# EAGLE design evb_to_w_adapter (EAGLE 6.2)
Assembly variants: ACSI, SCSI
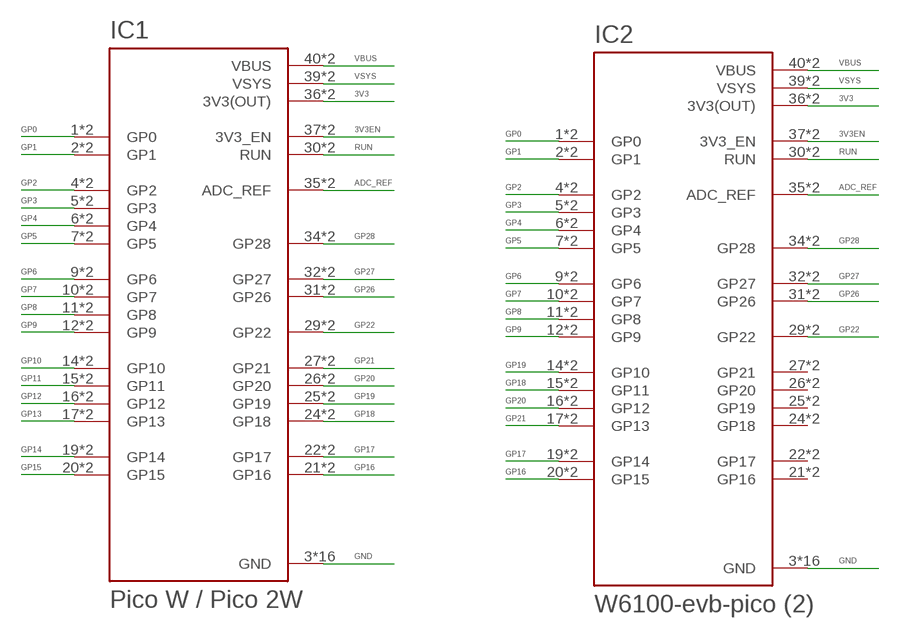
[diagram p0: schematic, sheet 1]

## Parts
IC1  Pico W / Pico 2W  RASPBERRY_PICOSMD-TH  [PICO-PKG]
IC2  W6100-evb-pico (2)  RASPBERRY_PICOSMD-TH  [PICO-PKG]

## Nets
3V3: IC1.36(3V3(OUT)) IC1.P$36(3V3(OUT)) IC2.36(3V3(OUT)) IC2.P$36(3V3(OUT))
3V3EN: IC1.37(3V3_EN) IC1.P$37(3V3_EN) IC2.37(3V3_EN) IC2.P$37(3V3_EN)
ADC_REF: IC1.35(ADC_REF) IC1.P$35(ADC_REF) IC2.35(ADC_REF) IC2.P$35(ADC_REF)
GND: IC1.3(GND) IC1.8(GND) IC1.13(GND) IC1.18(GND) IC1.23(GND) IC1.28(GND) IC1.33(GND) IC1.38(GND) IC1.P$3(GND) IC1.P$8(GND) IC1.P$13(GND) IC1.P$18(GND) IC1.P$23(GND) IC1.P$28(GND) IC1.P$33(GND) IC1.P$38(GND) IC2.3(GND) IC2.8(GND) IC2.13(GND) IC2.18(GND) IC2.23(GND) IC2.28(GND) IC2.33(GND) IC2.38(GND) IC2.P$3(GND) IC2.P$8(GND) IC2.P$13(GND) IC2.P$18(GND) IC2.P$23(GND) IC2.P$28(GND) IC2.P$33(GND) IC2.P$38(GND)
GP0: IC1.1(GP0) IC1.P$1(GP0) IC2.1(GP0) IC2.P$1(GP0)
GP1: IC1.2(GP1) IC1.P$2(GP1) IC2.2(GP1) IC2.P$2(GP1)
GP2: IC1.4(GP2) IC1.P$4(GP2) IC2.4(GP2) IC2.P$4(GP2)
GP3: IC1.5(GP3) IC1.P$5(GP3) IC2.5(GP3) IC2.P$5(GP3)
GP4: IC1.6(GP4) IC1.P$6(GP4) IC2.6(GP4) IC2.P$6(GP4)
GP5: IC1.7(GP5) IC1.P$7(GP5) IC2.7(GP5) IC2.P$7(GP5)
GP6: IC1.9(GP6) IC1.P$9(GP6) IC2.9(GP6) IC2.P$9(GP6)
GP7: IC1.10(GP7) IC1.P$10(GP7) IC2.10(GP7) IC2.P$10(GP7)
GP8: IC1.11(GP8) IC1.P$11(GP8) IC2.11(GP8) IC2.P$11(GP8)
GP9: IC1.12(GP9) IC1.P$12(GP9) IC2.12(GP9) IC2.P$12(GP9)
GP10: IC1.14(GP10) IC1.P$14(GP10)
GP11: IC1.15(GP11) IC1.P$15(GP11)
GP12: IC1.16(GP12) IC1.P$16(GP12)
GP13: IC1.17(GP13) IC1.P$17(GP13)
GP14: IC1.19(GP14) IC1.P$19(GP14)
GP15: IC1.20(GP15) IC1.P$20(GP15)
GP16: IC1.21(GP16) IC1.P$21(GP16) IC2.20(GP15) IC2.P$20(GP15)
GP17: IC1.22(GP17) IC1.P$22(GP17) IC2.19(GP14) IC2.P$19(GP14)
GP18: IC1.24(GP18) IC1.P$24(GP18) IC2.15(GP11) IC2.P$15(GP11)
GP19: IC1.25(GP19) IC1.P$25(GP19) IC2.14(GP10) IC2.P$14(GP10)
GP20: IC1.26(GP20) IC1.P$26(GP20) IC2.16(GP12) IC2.P$16(GP12)
GP21: IC1.27(GP21) IC1.P$27(GP21) IC2.17(GP13) IC2.P$17(GP13)
GP22: IC1.29(GP22) IC1.P$29(GP22) IC2.29(GP22) IC2.P$29(GP22)
GP26: IC1.31(GP26) IC1.P$31(GP26) IC2.31(GP26) IC2.P$31(GP26)
GP27: IC1.32(GP27) IC1.P$32(GP27) IC2.32(GP27) IC2.P$32(GP27)
GP28: IC1.34(GP28) IC1.P$34(GP28) IC2.34(GP28) IC2.P$34(GP28)
RUN: IC1.30(RUN) IC1.P$30(RUN) IC2.30(RUN) IC2.P$30(RUN)
VBUS: IC1.40(VBUS) IC1.P$40(VBUS) IC2.40(VBUS) IC2.P$40(VBUS)
VSYS: IC1.39(VSYS) IC1.P$39(VSYS) IC2.39(VSYS) IC2.P$39(VSYS)
Unconnected: IC2.21(GP16) IC2.22(GP17) IC2.24(GP18) IC2.25(GP19) IC2.26(GP20) IC2.27(GP21) IC2.P$21(GP16) IC2.P$22(GP17) IC2.P$24(GP18) IC2.P$25(GP19) IC2.P$26(GP20) IC2.P$27(GP21)

## Library data of the parts
IC1 IC2 = RpiPico:RASPBERRY_PICO: Raspberry Pi Pico

## Board
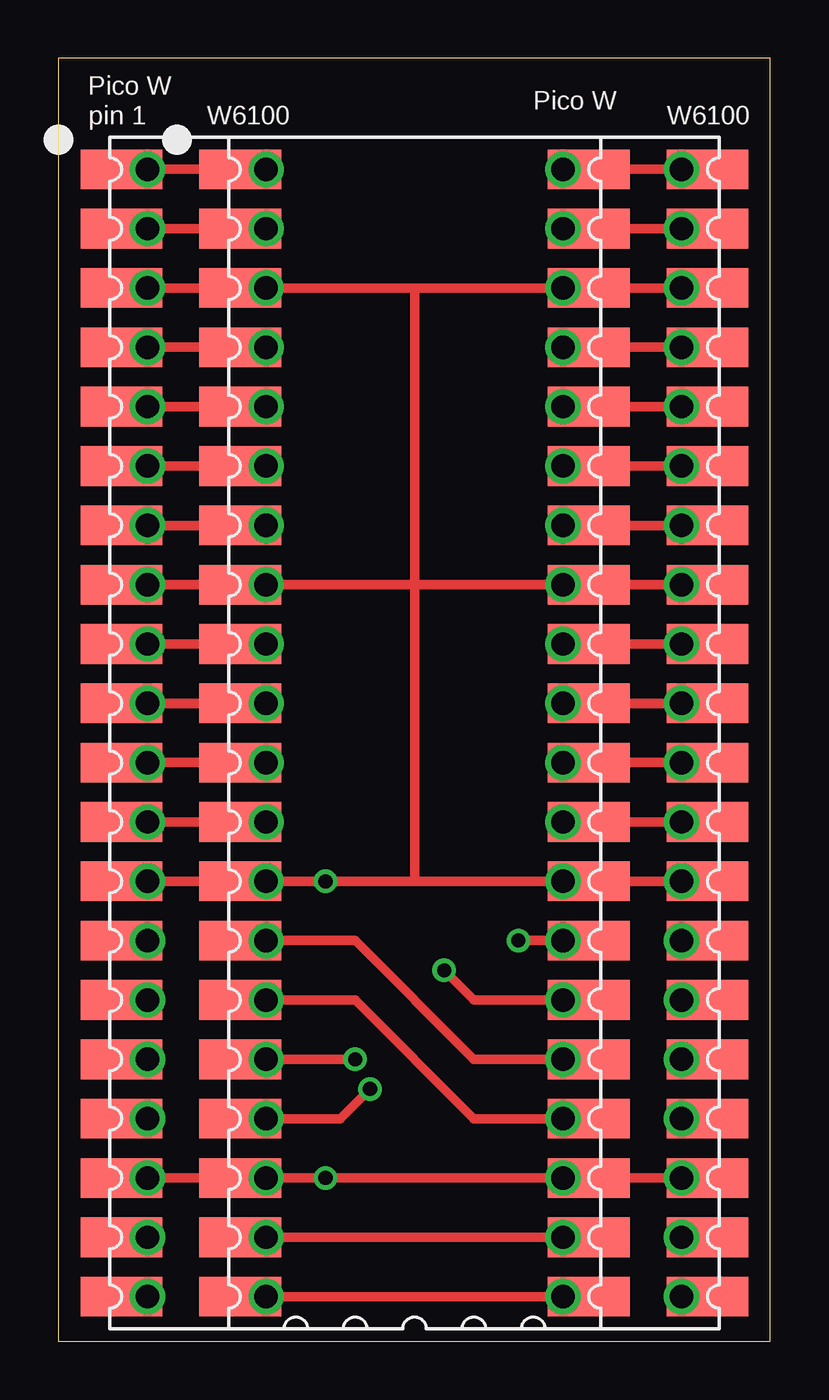
[diagram p1: board, top side]
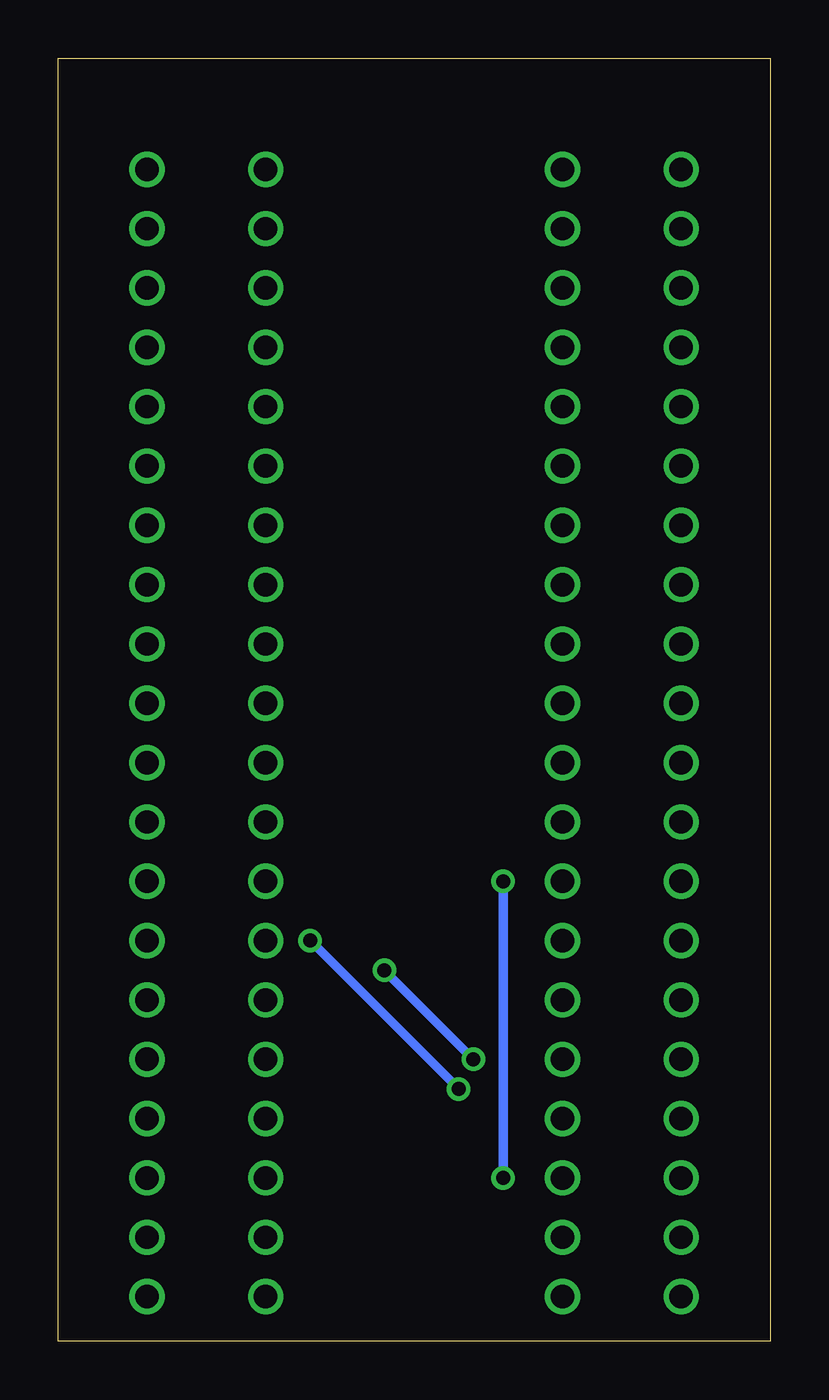
[diagram p2: board, bottom side, seen from below]

Size 30.46 x 54.91 mm. Coordinates in mm from the lower left corner, seen from the top.
Outline: 0,0 30.46,0 30.46,54.91 0,54.91 0,0
Copper layers (1*16): Top 0.035mm / dielectric 1.5mm / Bottom 0.035mm
Design rules: minimum track width 0.3mm, minimum drill 0.4mm, track to track 0.3mm, track to pad 0.3mm, pad to pad 0.3mm, via to via 0.3mm, smd to smd 8mil, copper to edge 0.5mm, drill to drill 8mil, minimum pad ring 10mil, minimum via ring 8mil, stop-mask expansion 4mil, vias tented up to drill 0mil, thermal gap 10mil

### Footprints (pad centres in the part's own frame; a part is rotated, then mirrored left to right if it is on the bottom)
PICO-PKG = drill 1: 1 -8.89,24.13; 2 -8.89,21.59; 3 -8.89,19.05; 4 -8.89,16.51; 5 -8.89,13.97; 6 -8.89,11.43; 7 -8.89,8.89; 8 -8.89,6.35; 9 -8.89,3.81; 10 -8.89,1.27; 11 -8.89,-1.27; 12 -8.89,-3.81; 13 -8.89,-6.35; 14 -8.89,-8.89; 15 -8.89,-11.43; 16 -8.89,-13.97; 17 -8.89,-16.51; 18 -8.89,-19.05; 19 -8.89,-21.59; 20 -8.89,-24.13; 21 8.89,-24.13; 22 8.89,-21.59; 23 8.89,-19.05; 24 8.89,-16.51; 25 8.89,-13.97; 26 8.89,-11.43; 27 8.89,-8.89; 28 8.89,-6.35; 29 8.89,-3.81; 30 8.89,-1.27; 31 8.89,1.27; 32 8.89,3.81; 33 8.89,6.35; 34 8.89,8.89; 35 8.89,11.43; 36 8.89,13.97; 37 8.89,16.51; 38 8.89,19.05; 39 8.89,21.59; 40 8.89,24.13 | smd 3.5 x 1.7: P$1 -10,24.13; P$2 -10,21.59; P$3 -10,19.05; P$4 -10,16.51; P$5 -10,13.97; P$6 -10,11.43; P$7 -10,8.89; P$8 -10,6.35; P$9 -10,3.81; P$10 -10,1.27; P$11 -10,-1.27; P$12 -10,-3.81; P$13 -10,-6.35; P$14 -10,-8.89; P$15 -10,-11.43; P$16 -10,-13.97; P$17 -10,-16.51; P$18 -10,-19.05; P$19 -10,-21.59; P$20 -10,-24.13; P$21 10,-24.13; P$22 10,-21.59; P$23 10,-19.05; P$24 10,-16.51; P$25 10,-13.97; P$26 10,-11.43; P$27 10,-8.89; P$28 10,-6.35; P$29 10,-3.81; P$30 10,-1.27; P$31 10,1.27; P$32 10,3.81; P$33 10,6.35; P$34 10,8.89; P$35 10,11.43; P$36 10,13.97; P$37 10,16.51; P$38 10,19.05; P$39 10,21.59; P$40 10,24.13

### Placement (x,y rotation side)
IC1  12.7,26.04 0 top
IC2  17.78,26.04 0 top

### Tracks (layer width: path | path; a pad name or v marks a point on that pad's centre or on a via)
3V3
  Top 0.406: IC1.36 IC1.P$36 IC2.36 IC2.P$36
3V3EN
  Top 0.406: IC1.37 IC1.P$37 IC2.37 IC2.P$37
ADC_REF
  Top 0.406: IC2.P$35 IC2.35 IC1.P$35 IC1.35
GND  (via drill 0.6)
  Top 0.406: IC1.P$3 IC1.3 IC2.P$3 IC2.3 15.24,45.09 | IC1.P$8 IC1.8 IC2.P$8 IC2.8 15.24,32.38 | IC1.P$13 IC1.13 IC2.P$13 IC2.13 v11.43,19.68 15.24,19.68 | IC1.P$18 IC1.18 IC2.P$18 IC2.18 v11.43,6.99 IC1.23 IC1.P$23 IC2.23 IC2.P$23 | IC2.P$38 IC2.38 IC1.P$38 IC1.38 15.24,45.09 | IC2.P$33 IC2.33 IC1.P$33 IC1.33 15.24,32.38 | IC2.P$28 IC2.28 IC1.P$28 IC1.28 15.24,19.68 | 15.24,45.09 15.24,32.38 | 15.24,32.38 15.24,19.68
  Bottom 0.406: v11.43,19.68 v11.43,6.99
GP0
  Top 0.406: IC1.P$1 IC1.1 IC2.P$1 IC2.1
GP1
  Top 0.406: IC2.2 IC2.P$2 IC1.2 IC1.P$2
GP2
  Top 0.406: IC2.4 IC2.P$4 IC1.4 IC1.P$4
GP3
  Top 0.406: IC1.P$5 IC1.5 IC2.P$5 IC2.5
GP4
  Top 0.406: IC2.6 IC2.P$6 IC1.6 IC1.P$6
GP5
  Top 0.406: IC1.P$7 IC1.7 IC2.P$7 IC2.7
GP6
  Top 0.406: IC1.P$9 IC1.9 IC2.P$9 IC2.9
GP7
  Top 0.406: IC2.10 IC2.P$10 IC1.10 IC1.P$10
GP8
  Top 0.406: IC1.P$11 IC1.11 IC2.P$11 IC2.11
GP9
  Top 0.406: IC1.P$12 IC1.12 IC2.P$12 IC2.12
GP10
  Top 0.406: IC1.14 IC1.P$14
GP11
  Top 0.406: IC1.15 IC1.P$15
GP12
  Top 0.406: IC1.16 IC1.P$16
GP13
  Top 0.406: IC1.17 IC1.P$17
GP14
  Top 0.406: IC1.19 IC1.P$19
GP15
  Top 0.406: IC1.P$20 IC1.20
GP16
  Top 0.406: IC2.P$20 IC2.20 IC1.21 IC1.P$21
GP17
  Top 0.406: IC2.P$19 IC2.19 IC1.22 IC1.P$22
GP18
  Top 0.406: IC2.P$15 IC2.15 12.7,14.61 17.78,9.53 IC1.24 IC1.P$24
GP19
  Top 0.406: IC2.P$14 IC2.14 12.7,17.14 17.78,12.06 IC1.25 IC1.P$25
GP20  (via drill 0.6)
  Top 0.406: IC2.P$16 IC2.16 v12.7,12.06 | IC1.P$26 IC1.26 17.78,14.61 v16.51,15.88
  Bottom 0.406: v16.51,15.88 v12.7,12.06
GP21  (via drill 0.6)
  Top 0.406: IC2.P$17 IC2.17 12.06,9.53 v13.34,10.79 | IC1.P$27 IC1.27 v19.68,17.14
  Bottom 0.406: v13.34,10.79 v19.68,17.14
GP22
  Top 0.406: IC1.29 IC1.P$29 IC2.29 IC2.P$29
GP26
  Top 0.406: IC1.31 IC1.P$31 IC2.31 IC2.P$31 27.94,27.3
GP27
  Top 0.406: IC1.32 IC1.P$32 IC2.32 IC2.P$32
GP28
  Top 0.406: IC1.34 IC1.P$34 IC2.34 IC2.P$34
RUN
  Top 0.406: IC1.30 IC1.P$30 IC2.30 IC2.P$30
VBUS
  Top 0.406: IC1.40 IC1.P$40 IC2.40 IC2.P$40
VSYS
  Top 0.406: IC1.39 IC1.P$39 IC2.39 IC2.P$39

### Text on the board
tPlace: Pico W | Pico W | pin 1 | W6100 | W6100